# Altium project Vortex_PID_Main.PrjPcb
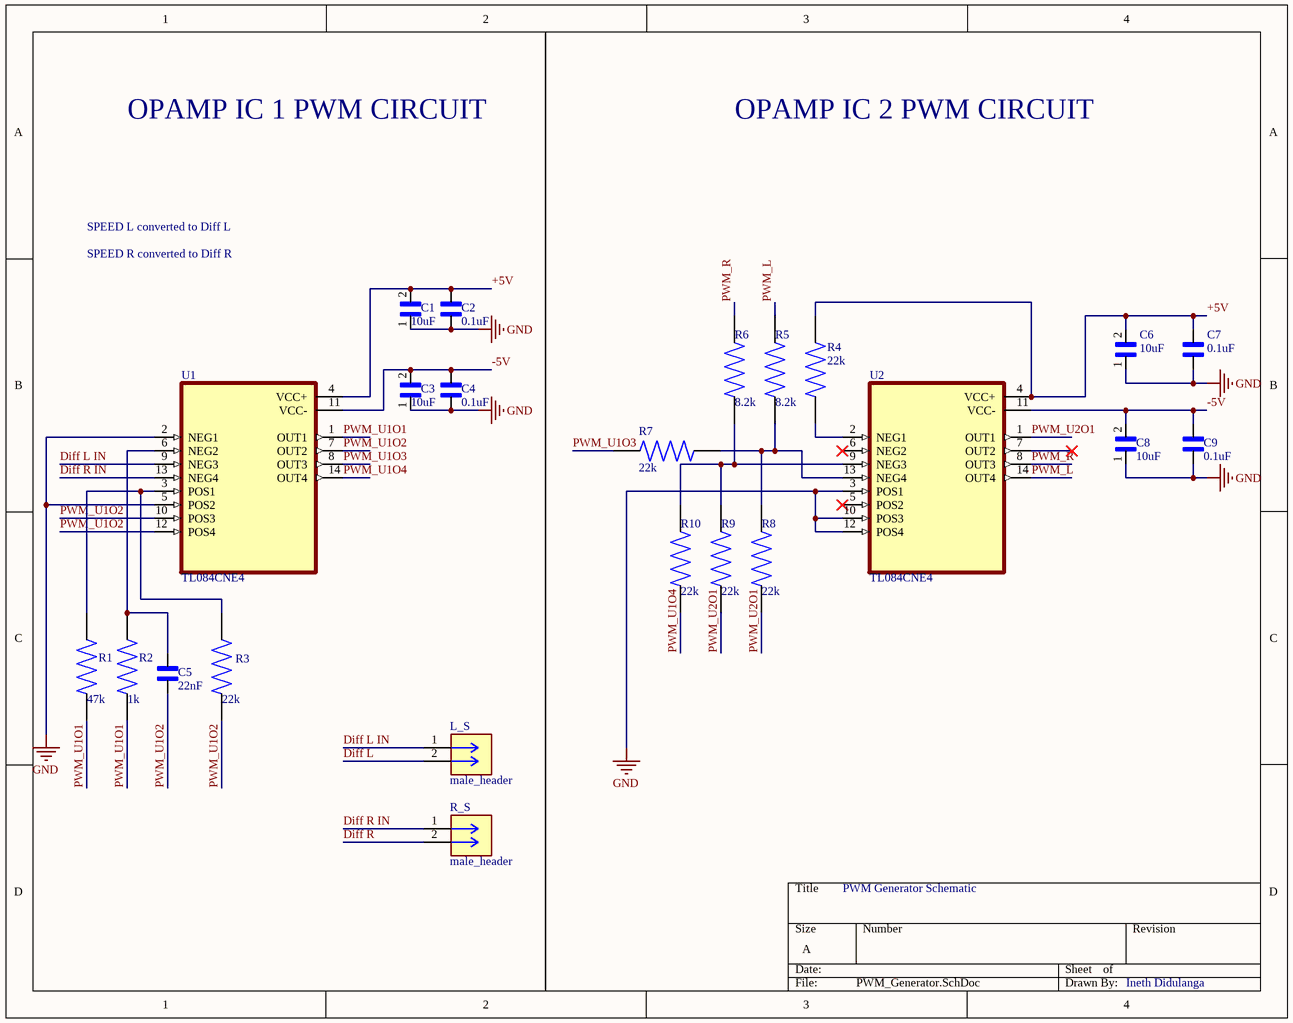
[diagram p0: PWM_Generator.SchDoc]
7 sheets, 148 parts. Net scope: global (net labels, ports and power ports of the same name join across sheets).
Board file: Vortex_PCB_final.PcbDoc
Sheets:
  PWM_Generator.SchDoc
  Differential_Drive_Mixer.SchDoc
  Sensor_Interface_SharpIR.SchDoc
  Mosfet_HBridge_Driver.SchDoc
  Power_Management.SchDoc
  PID_Controller.SchDoc
  Front Obstacle Brake.SchDoc

## Sheet PWM_Generator.SchDoc
size A; SheetNumber: 1; SheetTotal: 7

### Parts
C1  10uF  [CAPC2012X145N]
C2  0.1uF  [CAPC2012X140N]
C3  10uF  [CAPC2012X145N]
C4  0.1uF  [CAPC2012X140N]
C5  22nF  [CAPC2012X135N]
C6  10uF  [CAPC2012X145N]
C7  0.1uF  [CAPC2012X140N]
C8  10uF  [CAPC2012X145N]
C9  0.1uF  [CAPC2012X140N]
L_S  male_header  [CONN02_901200922_MOL]
R1  47k  [RESC2012X65N]
R2  1k  [RESC2012X55N]
R3  22k  [RESC2012X65N]
R4  22k  [RESC2012X65N]
R5  8.2k  [RESC2012X65N]
R6  8.2k  [RESC2012X65N]
R7  22k  [RESC2012X65N]
R8  22k  [RESC2012X65N]
R9  22k  [RESC2012X65N]
R10  22k  [RESC2012X65N]
R_S  male_header  [CONN02_901200922_MOL]
U1  TL084CNE4  [SOIC127P780X200-14N]
U2  TL084CNE4  [SOIC127P780X200-14N]

### Nets
+5V: C1.2 C2.1 C6.2 C7.1 R4.2 U1.4(VCC+) U2.4(VCC+)
-5V: C3.2 C4.1 C8.2 C9.1 U1.11(VCC-) U2.11(VCC-)
GND: C1.1 C2.2 C3.1 C4.2 C6.1 C7.2 C8.1 C9.2 U1.2(NEG1) U1.5(POS2) U2.3(POS1) U2.10(POS3) U2.12(POS4)
Diff L: L_S.2
Diff L IN: L_S.1 U1.9(NEG3)
Diff R: R_S.2
Diff R IN: R_S.1 U1.13(NEG4)
PWM_L: R5.2 U2.14(OUT4)
PWM_R: R6.2 U2.8(OUT3)
PWM_U1O1: R1.1 R2.1 U1.1(OUT1)
PWM_U1O2: C5.1 R3.1 U1.7(OUT2) U1.10(POS3) U1.12(POS4)
PWM_U1O3: R7.1 U1.8(OUT3)
PWM_U1O4: R10.1 U1.14(OUT4)
PWM_U2O1: R8.1 R9.1 U2.1(OUT1)
NetC5_2: C5.2 R2.2 U1.6(NEG2)
NetR1_2: R1.2 R3.2 U1.3(POS1)
NetR4_1: R4.1 U2.2(NEG1)
NetR5_1: R5.1 R7.2 R8.2 U2.13(NEG4)
NetR6_1: R6.1 R9.2 R10.2 U2.9(NEG3)

Not connected (* = marked no-connect by the designer): U2 5(POS2)* 6(NEG2)* 7(OUT2)*

### Notes on the sheet
- OPAMP IC 1 PWM CIRCUIT
- OPAMP IC 2 PWM CIRCUIT
- SPEED L converted to Diff L
- SPEED R converted to Diff R
- PWM Generator Schematic
- Ineth Didulanga

### Library data of the parts
C1 C3 C6 C8 = C2012X6S1C106K125AC: C Series 0805 10 uF 16 V Â±10 % Tolerance X6S SMT Multilayer Ceramic Capacitor; MF: TDK; MP: C2012X6S1C106K125AC; SnapEDA_Link: https://www.snapeda.com/parts/C2012X6S1C106K125AC/TDK-Lambda+Americas+Inc/view-part/?ref=snap; Check_prices: https://www.snapeda.com/parts/C2012X6S1C106K125AC/TDK-Lambda+Americas+Inc/view-part/?ref=eda; Value: *; Purchase-URL: https://pricing.snapeda.com/search/part/C2012X6S1C106K125AC/?ref=eda; Package: 2012 TDK
C2 C4 C7 C9 = FS055C104K4Z2A: 0.1 ÂµF Â±10% 50V Ceramic Capacitor X7R 0805 (2012 Metric); MF: AVX; SnapEDA_Link: https://www.snapeda.com/parts/FS055C104K4Z2A/AVX/view-part/?ref=snap; Package: 0805-2 AVX; Value: *; MP: FS055C104K4Z2A; Check_prices: https://www.snapeda.com/parts/FS055C104K4Z2A/AVX/view-part/?ref=eda
C5 = GRM21B5C1H223JA01L: 0805 22 nF 50 V Â±5% Tolerance C0G SMT Multilayer Ceramic Capacitor; MF: Murata; SnapEDA_Link: https://www.snapeda.com/parts/GRM21B5C1H223JA01L/Murata/view-part/?ref=snap; Package: 805-2 Murata; Value: *; MP: GRM21B5C1H223JA01L; Check_prices: https://www.snapeda.com/parts/GRM21B5C1H223JA01L/Murata/view-part/?ref=eda
L_S R_S = 901200922: Package: None; Price: None; Value: *; MP: 901200922; Availability: Unavailable
R1 = CRGCQ0805F47K: Fixed Resistor CRGCQ 0805 47K 1%; MF: TE Connectivity; SnapEDA_Link: https://www.snapeda.com/parts/CRGCQ0805F47K/TE+Connectivity/view-part/?ref=snap; Package: 2012 TE Connectivity; Value: *; MP: CRGCQ0805F47K; Check_prices: https://www.snapeda.com/parts/CRGCQ0805F47K/TE+Connectivity/view-part/?ref=eda
R2 = MCU08050C1002FPW00: Res Thin Film 0805 10K Ohm 1% 0.125W(1/8W) Â±50ppm/Â°C Sulfur Resistant Pad SMD Automotive Medical T/R; MF: Vishay; SnapEDA_Link: https://www.snapeda.com/parts/MCU08050C1002FPW00/Vishay/view-part/?ref=snap; Package: 2012 Vishay; Value: *; MP: MCU08050C1002FPW00; Check_prices: https://www.snapeda.com/parts/MCU08050C1002FPW00/Vishay/view-part/?ref=eda
R3-R10 = CRGCQ0805F22K: Fixed Resistor CRGCQ 0805 22K 1%; MF: TE Connectivity; SnapEDA_Link: https://www.snapeda.com/parts/CRGCQ0805F22K/TE+Connectivity/view-part/?ref=snap; Package: 2012 TE Connectivity; Value: *; MP: CRGCQ0805F22K; Check_prices: https://www.snapeda.com/parts/CRGCQ0805F22K/TE+Connectivity/view-part/?ref=eda
U1 U2 = TL084CNE4: Quad High Slew Rate JFET-Input Operational Amplifier 14-PDIP 0 to 70; MF: Texas Instruments; SnapEDA_Link: https://www.snapeda.com/parts/TL084CNE4/Texas+Instruments/view-part/?ref=snap; Package: PDIP-14 Texas Instruments; Value: *; MP: TL084CNE4; Check_prices: https://www.snapeda.com/parts/TL084CNE4/Texas+Instruments/view-part/?ref=eda

## Sheet Differential_Drive_Mixer.SchDoc
size A; SheetNumber: 2; SheetTotal: 7
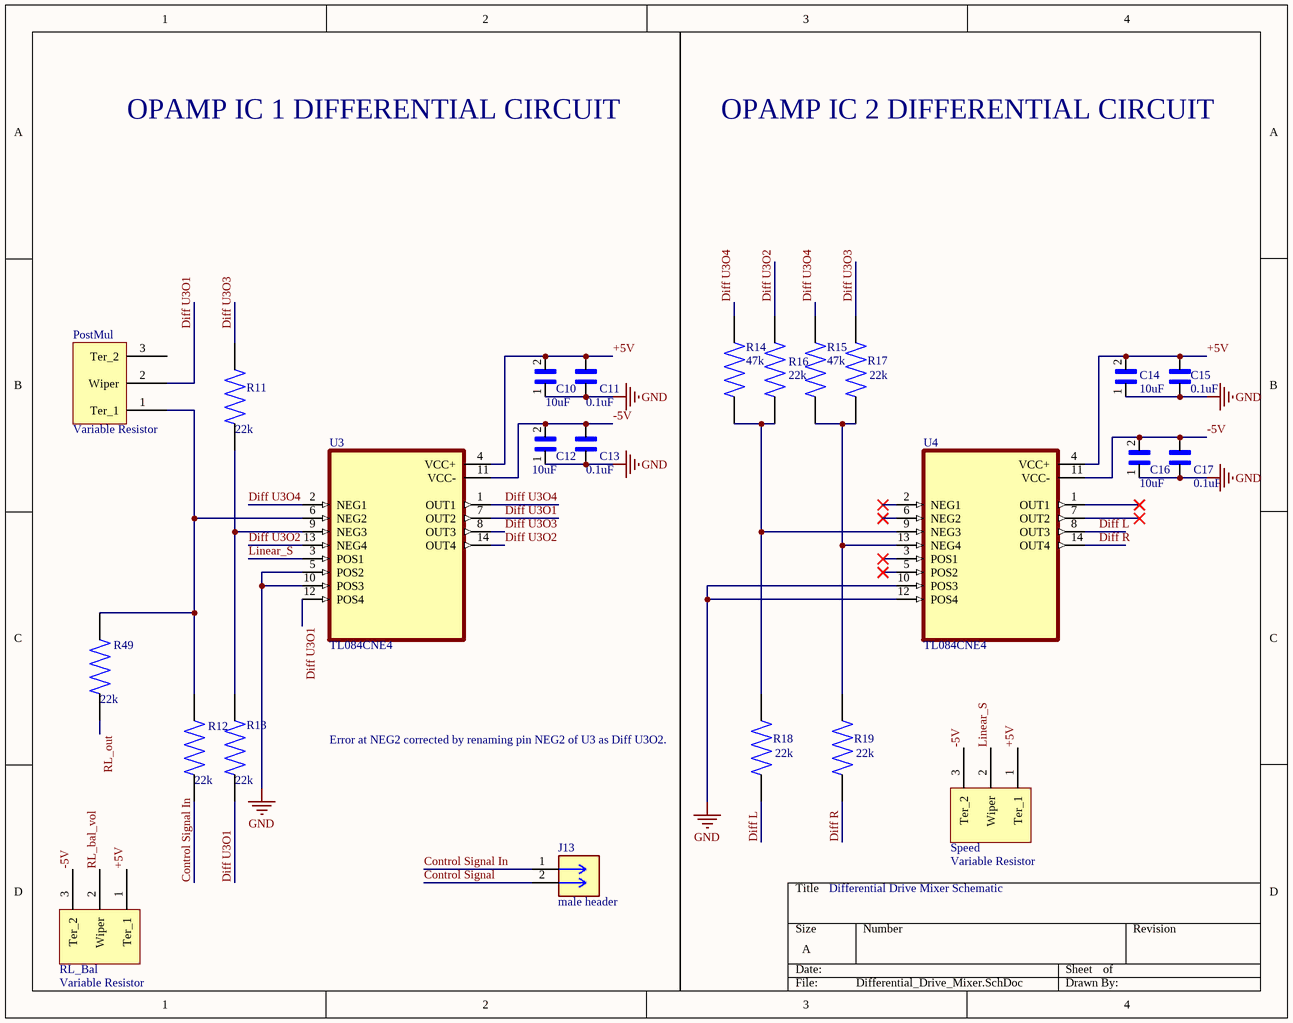
[diagram p1: Differential_Drive_Mixer.SchDoc]

### Parts
C10  10uF  [CAPC2012X145N]
C11  0.1uF  [CAPC2012X140N]
C12  10uF  [CAPC2012X145N]
C13  0.1uF  [CAPC2012X140N]
C14  10uF  [CAPC2012X145N]
C15  0.1uF  [CAPC2012X140N]
C16  10uF  [CAPC2012X145N]
C17  0.1uF  [CAPC2012X140N]
J13  male header  [CONN02_901200922_MOL]
PostMul  Variable Resistor  [PCBComponent_1]
R11  22k  [RESC2012X65N]
R12  22k  [RESC2012X65N]
R13  22k  [RESC2012X65N]
R14  47k  [RESC2012X65N]
R15  47k  [RESC2012X65N]
R16  22k  [RESC2012X65N]
R17  22k  [RESC2012X65N]
R18  22k  [RESC2012X65N]
R19  22k  [RESC2012X65N]
R49  22k  [RESC2012X65N]
RL_Bal  Variable Resistor  [PCBComponent_1]
Speed  Variable Resistor  [PCBComponent_1]
U3  TL084CNE4  [SOIC127P780X200-14N]
U4  TL084CNE4  [SOIC127P780X200-14N]

### Nets
+5V: C10.2 C11.1 C14.2 C15.1 RL_Bal.1(Ter_1) Speed.1(Ter_1) U3.4(VCC+) U4.4(VCC+)
-5V: C12.2 C13.1 C16.2 C17.1 RL_Bal.3(Ter_2) Speed.3(Ter_2) U3.11(VCC-) U4.11(VCC-)
GND: C10.1 C11.2 C12.1 C13.2 C14.1 C15.2 C16.1 C17.2 U3.5(POS2) U3.10(POS3) U4.10(POS3) U4.12(POS4)
Control Signal: J13.2
Control Signal In: J13.1 R12.1
Diff L: R18.2 U4.8(OUT3)
Diff R: R19.2 U4.14(OUT4)
Diff U3O1: PostMul.2(Wiper) R13.1 U3.7(OUT2) U3.12(POS4)
Diff U3O2: R16.1 U3.13(NEG4) U3.14(OUT4)
Diff U3O3: R11.1 R17.1 U3.8(OUT3)
Diff U3O4: R14.2 R15.2 U3.1(OUT1) U3.2(NEG1)
Linear_S: Speed.2(Wiper) U3.3(POS1)
RL_bal_vol: RL_Bal.2(Wiper)
RL_out: R49.1
NetPostMul_1: PostMul.1(Ter_1) R12.2 R49.2 U3.6(NEG2)
NetR11_2: R11.2 R13.2 U3.9(NEG3)
NetR14_1: R14.1 R16.2 R18.1 U4.9(NEG3)
NetR15_1: R15.1 R17.2 R19.1 U4.13(NEG4)

Not connected (* = marked no-connect by the designer): PostMul 3(Ter_2); U4 1(OUT1)* 2(NEG1)* 3(POS1)* 5(POS2)* 6(NEG2)* 7(OUT2)*

### Notes on the sheet
- OPAMP IC 1 DIFFERENTIAL CIRCUIT
- OPAMP IC 2 DIFFERENTIAL CIRCUIT
- (near R18) Error at NEG2 corrected by renaming pin NEG2 of U3 as Diff U3O2.
- Differential Drive Mixer Schematic

### Library data of the parts
C10 C12 C14 C16 = C2012X6S1C106K125AC: as C1 on sheet PWM_Generator; MP: C2012X6S1C106K125AC; SnapEDA_Link: https://www.snapeda.com/parts/C2012X6S1C106K125AC/TDK-Lambda+Americas+Inc/view-part/?ref=snap; Check_prices: https://www.snapeda.com/parts/C2012X6S1C106K125AC/TDK-Lambda+Americas+Inc/view-part/?ref=eda; Value: *; Purchase-URL: https://pricing.snapeda.com/search/part/C2012X6S1C106K125AC/?ref=eda; Package: 2012 TDK
C11 C13 C15 C17 = FS055C104K4Z2A: as C2 on sheet PWM_Generator; SnapEDA_Link: https://www.snapeda.com/parts/FS055C104K4Z2A/AVX/view-part/?ref=snap; Package: 0805-2 AVX; Value: *; MP: FS055C104K4Z2A; Check_prices: https://www.snapeda.com/parts/FS055C104K4Z2A/AVX/view-part/?ref=eda
J13 = 901200922: Package: None; Price: None; Value: *; MP: 901200922; Availability: Unavailable
R11-R13 R16-R19 R49 = CRGCQ0805F22K: as R3 on sheet PWM_Generator; SnapEDA_Link: https://www.snapeda.com/parts/CRGCQ0805F22K/TE+Connectivity/view-part/?ref=snap; Package: 2012 TE Connectivity; Value: *; MP: CRGCQ0805F22K; Check_prices: https://www.snapeda.com/parts/CRGCQ0805F22K/TE+Connectivity/view-part/?ref=eda
R14 R15 = CRGCQ0805F47K: as R1 on sheet PWM_Generator; SnapEDA_Link: https://www.snapeda.com/parts/CRGCQ0805F47K/TE+Connectivity/view-part/?ref=snap; Package: 2012 TE Connectivity; Value: *; MP: CRGCQ0805F47K; Check_prices: https://www.snapeda.com/parts/CRGCQ0805F47K/TE+Connectivity/view-part/?ref=eda
U3 U4 = TL084CNE4: as U1 on sheet PWM_Generator; SnapEDA_Link: https://www.snapeda.com/parts/TL084CNE4/Texas+Instruments/view-part/?ref=snap; Package: PDIP-14 Texas Instruments; Value: *; MP: TL084CNE4; Check_prices: https://www.snapeda.com/parts/TL084CNE4/Texas+Instruments/view-part/?ref=eda

## Sheet Sensor_Interface_SharpIR.SchDoc
size A; SheetNumber: 3; SheetTotal: 7
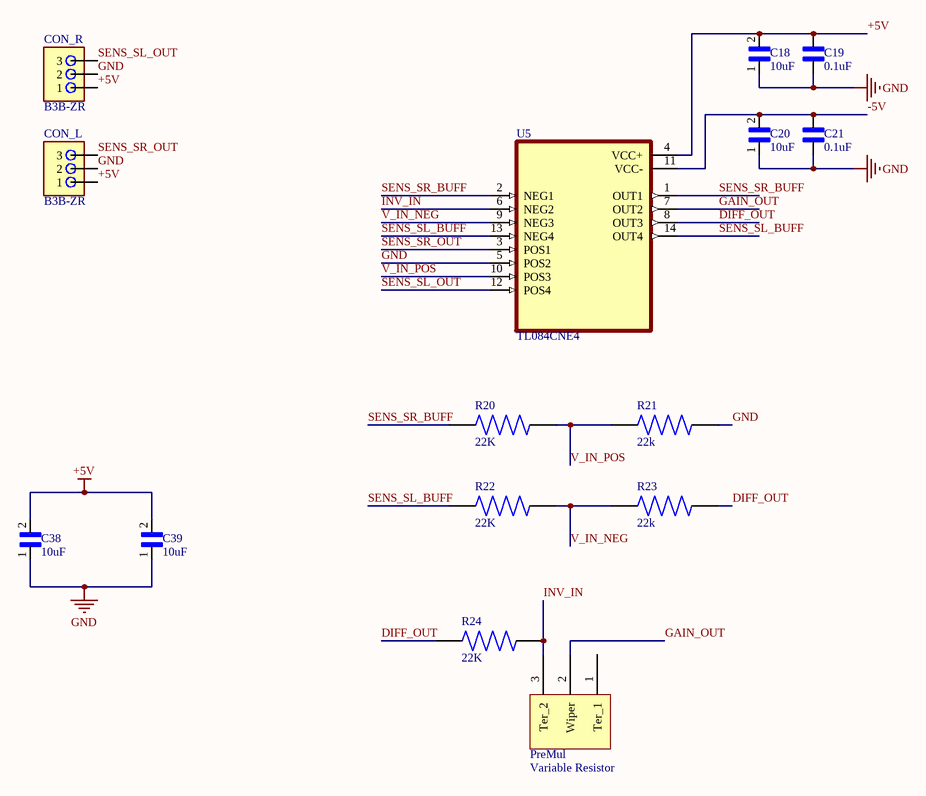
[diagram p2: Sensor_Interface_SharpIR.SchDoc]

### Parts
C18  10uF  [CAPC2012X145N]
C19  0.1uF  [CAPC2012X140N]
C20  10uF  [CAPC2012X145N]
C21  0.1uF  [CAPC2012X140N]
C38  10uF  [CAPC2012X145N]
C39  10uF  [CAPC2012X145N]
CON_L  B3B-ZR  [B3B-ZR]
CON_R  B3B-ZR  [B3B-ZR]
PreMul  Variable Resistor  [PCBComponent_1]
R20  22K  [RESC2012X65N]
R21  22k  [RESC2012X65N]
R22  22K  [RESC2012X65N]
R23  22k  [RESC2012X65N]
R24  22K  [RESC2012X65N]
U5  TL084CNE4  [SOIC127P780X200-14N]

### Nets
+5V: C18.2 C19.1 C38.2 C39.2 CON_L.1 CON_R.1 U5.4(VCC+)
-5V: C20.2 C21.1 U5.11(VCC-)
GND: C18.1 C19.2 C20.1 C21.2 C38.1 C39.1 CON_L.2 CON_R.2 R21.2 U5.5(POS2)
DIFF_OUT: R23.2 R24.1 U5.8(OUT3)
GAIN_OUT: PreMul.2(Wiper) U5.7(OUT2)
INV_IN: PreMul.3(Ter_2) R24.2 U5.6(NEG2)
SENS_SL_BUFF: R22.1 U5.13(NEG4) U5.14(OUT4)
SENS_SL_OUT: CON_R.3 U5.12(POS4)
SENS_SR_BUFF: R20.1 U5.1(OUT1) U5.2(NEG1)
SENS_SR_OUT: CON_L.3 U5.3(POS1)
V_IN_NEG: R22.2 R23.1 U5.9(NEG3)
V_IN_POS: R20.2 R21.1 U5.10(POS3)

Not connected (* = marked no-connect by the designer): PreMul 1(Ter_1)

### Library data of the parts
C18 C20 C38 C39 = C2012X6S1C106K125AC: as C1 on sheet PWM_Generator; MP: C2012X6S1C106K125AC; SnapEDA_Link: https://www.snapeda.com/parts/C2012X6S1C106K125AC/TDK-Lambda+Americas+Inc/view-part/?ref=snap; Check_prices: https://www.snapeda.com/parts/C2012X6S1C106K125AC/TDK-Lambda+Americas+Inc/view-part/?ref=eda; Value: *; Purchase-URL: https://pricing.snapeda.com/search/part/C2012X6S1C106K125AC/?ref=eda; Package: 2012 TDK
C19 C21 = FS055C104K4Z2A: as C2 on sheet PWM_Generator; SnapEDA_Link: https://www.snapeda.com/parts/FS055C104K4Z2A/AVX/view-part/?ref=snap; Package: 0805-2 AVX; Value: *; MP: FS055C104K4Z2A; Check_prices: https://www.snapeda.com/parts/FS055C104K4Z2A/AVX/view-part/?ref=eda
CON_L CON_R = B3B-ZR: Connector Header Surface Mount 3 position 0.059 (1.50mm); MF: JST Sales; SnapEDA_Link: https://www.snapeda.com/parts/B3B-ZR/JST+Sales+America+Inc./view-part/?ref=snap; Package: None; Value: *; MP: B3B-ZR; Check_prices: https://www.snapeda.com/parts/B3B-ZR/JST+Sales+America+Inc./view-part/?ref=eda
R20-R24 = CRGCQ0805F22K: as R3 on sheet PWM_Generator; SnapEDA_Link: https://www.snapeda.com/parts/CRGCQ0805F22K/TE+Connectivity/view-part/?ref=snap; Package: 2012 TE Connectivity; Value: *; MP: CRGCQ0805F22K; Check_prices: https://www.snapeda.com/parts/CRGCQ0805F22K/TE+Connectivity/view-part/?ref=eda
U5 = TL084CNE4: as U1 on sheet PWM_Generator; SnapEDA_Link: https://www.snapeda.com/parts/TL084CNE4/Texas+Instruments/view-part/?ref=snap; Package: PDIP-14 Texas Instruments; Value: *; MP: TL084CNE4; Check_prices: https://www.snapeda.com/parts/TL084CNE4/Texas+Instruments/view-part/?ref=eda

## Sheet Mosfet_HBridge_Driver.SchDoc
size A; SheetNumber: 4; SheetTotal: 7
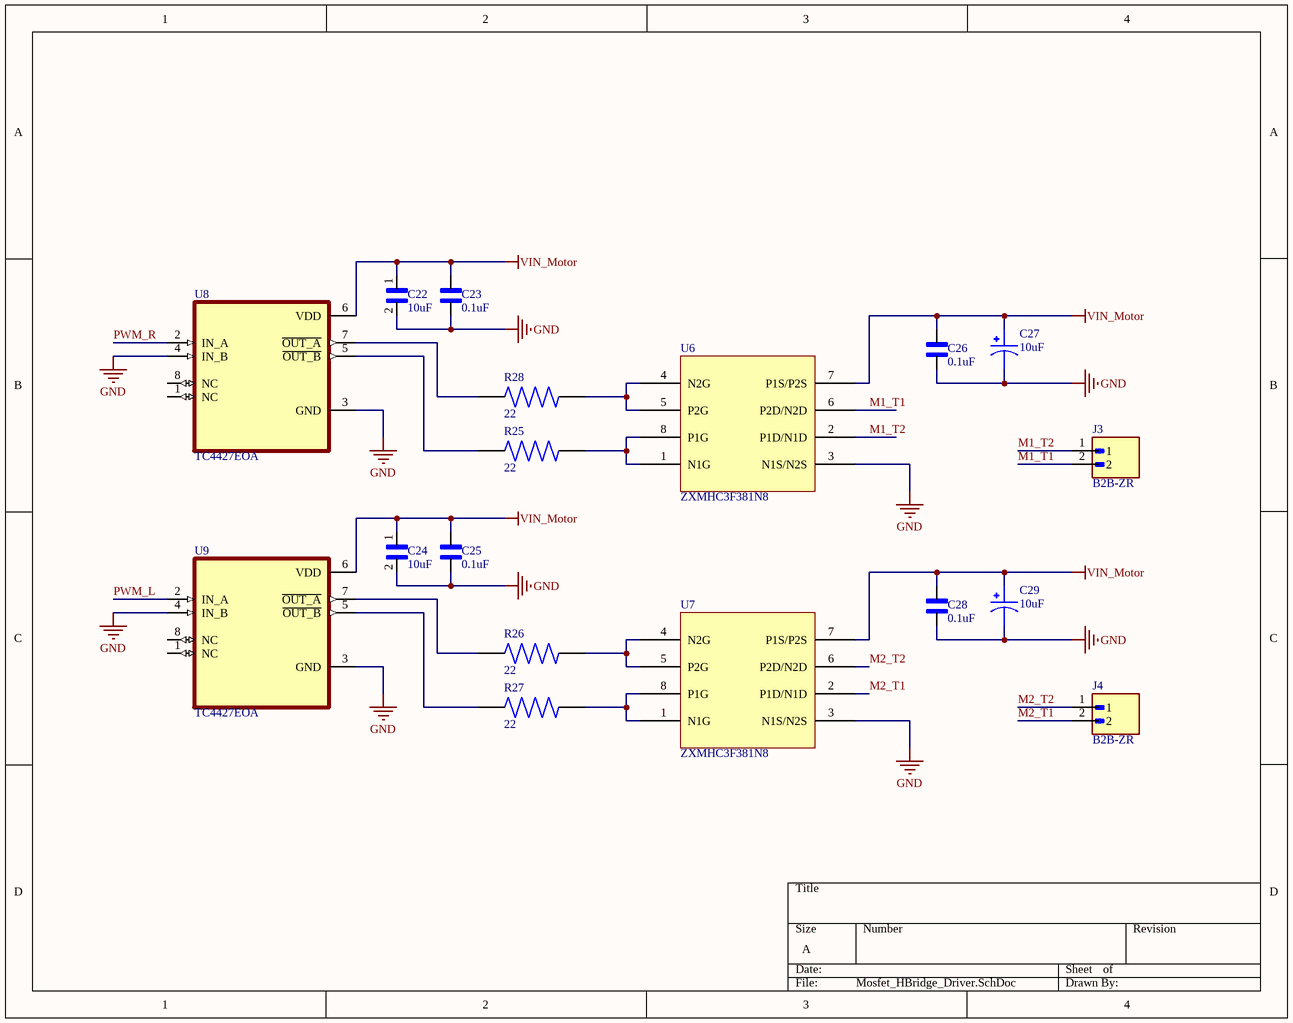
[diagram p3: Mosfet_HBridge_Driver.SchDoc]

### Parts
C22  10uF  [CAPC2012X145N]
C23  0.1uF  [CAPC2012X140N]
C24  10uF  [CAPC2012X145N]
C25  0.1uF  [CAPC2012X140N]
C26  0.1uF  [CAPC2012X140N]
C27  10uF  [CAPAE660X610N]
C28  0.1uF  [CAPC2012X140N]
C29  10uF  [CAPAE660X610N]
J3  B2B-ZR  [JST_B2B-ZR(LF)(SN)]
J4  B2B-ZR  [JST_B2B-ZR(LF)(SN)]
R25  22  [RES_ERJU06F22R0V]
R26  22  [RES_ERJU06F22R0V]
R27  22  [RES_ERJU06F22R0V]
R28  22  [RES_ERJU06F22R0V]
U6  ZXMHC3F381N8  [SOIC127P600X175-8N]
U7  ZXMHC3F381N8  [SOIC127P600X175-8N]
U8  TC4427EOA  [SOIC127P599X175-8N]
U9  TC4427EOA  [SOIC127P599X175-8N]

### Nets
GND: C22.2 C23.1 C24.2 C25.1 C26.1 C27.N(NEG) C28.1 C29.N(NEG) U6.3(N1S/N2S) U7.3(N1S/N2S) U8.3(GND) U8.4(IN_B) U9.3(GND) U9.4(IN_B)
VIN_Motor: C22.1 C23.2 C24.1 C25.2 C26.2 C27.P(POS) C28.2 C29.P(POS) U6.7(P1S/P2S) U7.7(P1S/P2S) U8.6(VDD) U9.6(VDD)
M1_T1: J3.2 U6.6(P2D/N2D)
M1_T2: J3.1 U6.2(P1D/N1D)
M2_T1: J4.2 U7.2(P1D/N1D)
M2_T2: J4.1 U7.6(P2D/N2D)
PWM_L: U9.2(IN_A)
PWM_R: U8.2(IN_A)
NetR25_1: R25.1 U8.5(~{OUT_B})
NetR25_2: R25.2 U6.1(N1G) U6.8(P1G)
NetR26_1: R26.1 U9.7(~{OUT_A})
NetR26_2: R26.2 U7.4(N2G) U7.5(P2G)
NetR27_1: R27.1 U9.5(~{OUT_B})
NetR27_2: R27.2 U7.1(N1G) U7.8(P1G)
NetR28_1: R28.1 U8.7(~{OUT_A})
NetR28_2: R28.2 U6.4(N2G) U6.5(P2G)

Not connected (* = marked no-connect by the designer): U8 1(NC) 8(NC); U9 1(NC) 8(NC)

### Library data of the parts
C22 C24 = C2012X6S1C106K125AC: as C1 on sheet PWM_Generator; MP: C2012X6S1C106K125AC; SnapEDA_Link: https://www.snapeda.com/parts/C2012X6S1C106K125AC/TDK-Lambda+Americas+Inc/view-part/?ref=snap; Check_prices: https://www.snapeda.com/parts/C2012X6S1C106K125AC/TDK-Lambda+Americas+Inc/view-part/?ref=eda; Value: *; Purchase-URL: https://pricing.snapeda.com/search/part/C2012X6S1C106K125AC/?ref=eda; Package: 2012 TDK
C23 C25 C26 C28 = FS055C104K4Z2A: as C2 on sheet PWM_Generator; SnapEDA_Link: https://www.snapeda.com/parts/FS055C104K4Z2A/AVX/view-part/?ref=snap; Package: 0805-2 AVX; Value: *; MP: FS055C104K4Z2A; Check_prices: https://www.snapeda.com/parts/FS055C104K4Z2A/AVX/view-part/?ref=eda
C27 C29 = UUD1H100MCL1GS: Aluminum Electrolytic Capacitors - SMD, Low Impediance, 50volts 10uF | Nichicon UUD1H100MCL1GS; SnapEDA_Link: https://www.snapeda.com/parts/UUD1H100MCL1GS/Nichicon/view-part/?ref=snap; Package: RADIAL-2 Nichicon; Value: *; MF: Nichicon; MP: UUD1H100MCL1GS; Check_prices: https://www.snapeda.com/parts/UUD1H100MCL1GS/Nichicon/view-part/?ref=eda
J3 J4 = B2B-ZR(LF)(SN): Connector Header Through Hole 2 position 0.059 (1.50mm); MF: JST Sales; SnapEDA_Link: https://www.snapeda.com/parts/B2B-ZR(LF)(SN)/JST+Sales+America+Inc./view-part/?ref=snap; Package: None; Value: *; MP: B2B-ZR(LF)(SN); Check_prices: https://www.snapeda.com/parts/B2B-ZR(LF)(SN)/JST+Sales+America+Inc./view-part/?ref=eda
R25-R28 = ERJU06F22R0V: MP: ERJU06F22R0V; Availability: Unavailable; Price: None; Package: None; Value: *
U6 U7 = ZXMHC3F381N8: N-Channel+P-Channel Array 30V 4.1A 0.95W Surface Mount SO-8
U8 U9 = TC4427EOA: Low-Side Gate Driver IC Non-Inverting 8-SOIC; MF: Microchip; Check_prices: https://www.snapeda.com/parts/TC4427EOA/Microchip/view-part/?ref=eda; Value: *; Availability: In Stock; MP: TC4427EOA; Price: None; Package: SOIC-8 Microchip; SnapEDA_Link: https://www.snapeda.com/parts/TC4427EOA/Microchip/view-part/?ref=snap; Purchase-URL: https://pricing.snapeda.com/search/part/TC4427EOA/?ref=eda

## Sheet Power_Management.SchDoc
size A; SheetNumber: 5; SheetTotal: 7
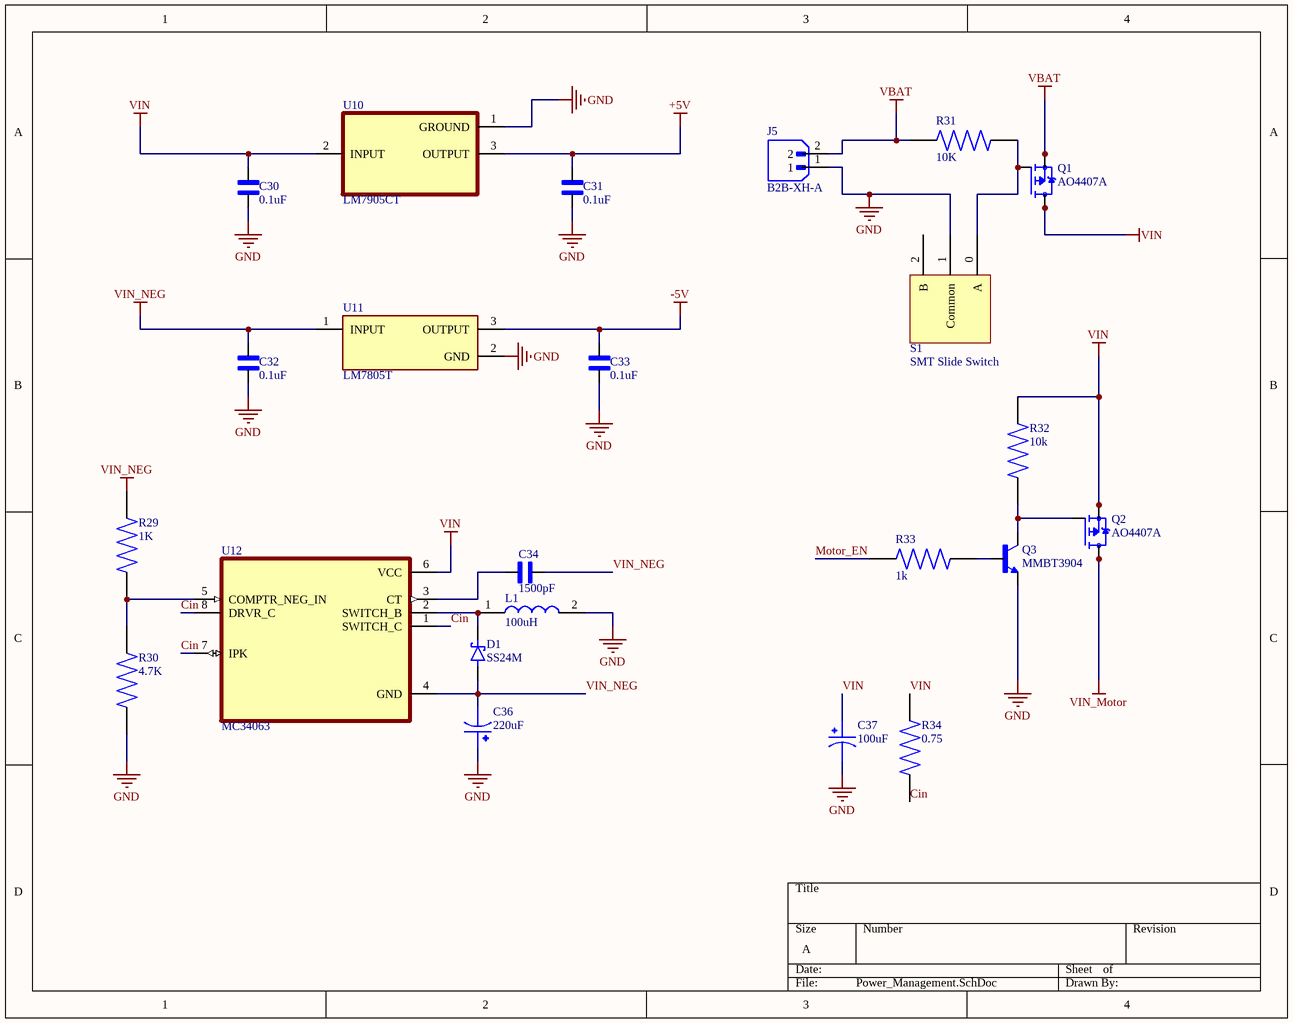
[diagram p4: Power_Management.SchDoc]

### Parts
C30  0.1uF  [CAPC2012X140N]
C31  0.1uF  [CAPC2012X140N]
C32  0.1uF  [CAPC2012X140N]
C33  0.1uF  [CAPC2012X140N]
C34  1500pF  [CAPC2012X145N]
C36  220uF  [CAPAE1030X1080N_UWT1H221MNL1GS]
C37  100uF  [CAPAE1030X1080N_UWT1H221MNL1GS]
D1  SS24M  [SODFL2512X73N]
J5  B2B-XH-A  [JST_B2B-XH-A]
L1  100uH  [INDPM125125X800N]
Q1  AO4407A  [SOIC127P600X175-8N]
Q2  AO4407A  [SOIC127P600X175-8N]
Q3  MMBT3904  [TRANS_MMBT3904]
R29  1K  [RES_ERJU06F1001V]
R30  4.7K  [RES_ERJU06F1001V]
R31  10K  [RESC2012X55N]
R32  10k  [RESC2012X55N]
R33  1k  [RES_ERJU06F1001V]
R34  0.75  [RES_ERJ6BQJR75V]
S1  SMT Slide Switch  [PCBComponent_1]
U10  LM7905CT  [TO254P1054X470X1955-3]
U11  LM7805T  [TO254P1011X457X1950-3]
U12  MC34063  [SOIC127P599X175-8N]

### Nets
+5V: C31.2 U10.3(OUTPUT)
-5V: C33.2 U11.3(OUTPUT)
GND: C30.1 C31.1 C32.1 C33.1 C36.1 C37.2 J5.1 L1.2 Q3.2(E) R30.1 S1.1(Common) U10.1(GROUND) U11.2(GND)
VBAT: J5.2 Q1.1(S) Q1.2(S) Q1.3(S) R31.1
VIN: C30.2 C37.1 Q1.5(D) Q1.6(D) Q1.7(D) Q1.8(D) Q2.1(S) Q2.2(S) Q2.3(S) R32.2 R34.2 U10.2(INPUT) U12.6(VCC)
VIN_Motor: Q2.5(D) Q2.6(D) Q2.7(D) Q2.8(D)
VIN_NEG: C32.2 C34.2 C36.2 D1.A R29.2 U11.1(INPUT) U12.4(GND)
Cin: R34.1 U12.1(SWITCH_C) U12.7(IPK) U12.8(DRVR_C)
Motor_EN: R33.1
NetC34_1: C34.1 U12.3(CT)
NetD1_C: D1.C(K) L1.1 U12.2(SWITCH_B)
NetQ1_4: Q1.4(G) R31.2 S1.0(A)
NetQ2_4: Q2.4(G) Q3.3(C) R32.1
NetQ3_1: Q3.1(B) R33.2
NetR29_1: R29.1 R30.2 U12.5(COMPTR_NEG_IN)

Not connected (* = marked no-connect by the designer): S1 2(B)

### Library data of the parts
C30-C33 = FS055C104K4Z2A: as C2 on sheet PWM_Generator; SnapEDA_Link: https://www.snapeda.com/parts/FS055C104K4Z2A/AVX/view-part/?ref=snap; Package: 0805-2 AVX; Value: *; MP: FS055C104K4Z2A; Check_prices: https://www.snapeda.com/parts/FS055C104K4Z2A/AVX/view-part/?ref=eda
C34 = VJ0805A152JXAAC: 1500 pF Â±5% 50V Ceramic Capacitor C0G, NP0 0805 (2012 Metric); MF: Vishay Vitramon; SnapEDA_Link: https://www.snapeda.com/parts/VJ0805A152JXAAC/Vishay/view-part/?ref=snap; Package: 2012 Vishay Vitramon; Value: *; MP: VJ0805A152JXAAC; Check_prices: https://www.snapeda.com/parts/VJ0805A152JXAAC/Vishay/view-part/?ref=eda
C36 C37 = UWT1H221MNL1GS: 220ÂµF 50V Aluminum Electrolytic Capacitors Radial, Can - SMD 1000 Hrs @ 105Â°C; MF: Nichicon; Package: Radial Nichicon; Price: None; Availability: Unavailable; MP: UWT1H221MNL1GS; SnapEDA_Link: https://www.snapeda.com/parts/UWT1H221MNL1GS/Nichicon/view-part/566503/?ref=snap; Value: *
J5 = B2B-XH-A: MF: {'manufacturer': u'JST Sales America Inc.'}; Package: None; Price: None; Value: *; MP: B2B-XH-A; Availability: Unavailable
L1 = SRR1280-101M: 100ÂµH Shielded Wirewound Inductor 2.1A 150mOhm Max Nonstandard; MF: Bourns; Purchase-URL: https://pricing.snapeda.com/search/part/SRR1280-101M/?ref=eda; Price: None; SnapEDA_Link: https://www.snapeda.com/parts/SRR1280-101M/Bourns%20-%20J.W.%20Miller/view-part/289867/?ref=snap; MP: SRR1280-101M; Availability: Good; Value: *; Check_prices: https://www.snapeda.com/parts/SRR1280-101M/Bourns%20-%20J.W.%20Miller/view-part/289867/?ref=eda; Package: Nonstandard Bourns
Q1 Q2 = AO4407A: P-Channel 30 V 12A (Ta) 3.1W (Ta) Surface Mount 8-SOIC; MF: Alpha &; SnapEDA_Link: https://www.snapeda.com/parts/AO4407A/Alpha/view-part/?ref=snap; Package: SOIC-8 Alpha &amp; Omega Semiconductor; Value: *; MP: AO4407A; Check_prices: https://www.snapeda.com/parts/AO4407A/Alpha/view-part/?ref=eda
Q3 = MMBT3904: BJT, SOT-23, 40V, 200mA, NPN, 0.35W, 150Â°C; MF: Diotec Semiconductor; SnapEDA_Link: https://www.snapeda.com/parts/MMBT3904/Diotec/view-part/?ref=snap; Package: SOT-23 Diotec; Value: *; MP: MMBT3904; Check_prices: https://www.snapeda.com/parts/MMBT3904/Diotec/view-part/?ref=eda
R29 R30 R33 = ERJU06F1001V: Res Thick Film 0805 1K Ohm 1% 0.125W(1/8W) Â±100ppm/C Sulfur Resistant Pad SMD Automotive T/R; MF: Panasonic; Availability: No availability data; Value: *; Check_prices: https://www.snapeda.com/parts/ERJU06F1001V/Panasonic/view-part/5742057/?ref=eda; Package: 2012-2 Panasonic; SnapEDA_Link: https://www.snapeda.com/parts/ERJU06F1001V/Panasonic/view-part/5742057/?ref=snap; Price: None; MP: ERJU06F1001V
R31 R32 = MCU08050C1002FPW00: as R2 on sheet PWM_Generator; SnapEDA_Link: https://www.snapeda.com/parts/MCU08050C1002FPW00/Vishay/view-part/?ref=snap; Package: 2012 Vishay; Value: *; MP: MCU08050C1002FPW00; Check_prices: https://www.snapeda.com/parts/MCU08050C1002FPW00/Vishay/view-part/?ref=eda
R34 = ERJ6BQJR75V: Value: *; MP: ERJ6BQJR75V; Availability: Unavailable; Price: None; Package: None
U10 = LM7905CT: 1.5-A, negative linear voltage regulator 3-TO-220 0 to 125; MF: Texas Instruments; SnapEDA_Link: https://www.snapeda.com/parts/LM7905CT/Texas+Instruments/view-part/?ref=snap; Package: TO-220-3 Texas Instruments; Value: *; MP: LM7905CT; Check_prices: https://www.snapeda.com/parts/LM7905CT/Texas+Instruments/view-part/?ref=eda
U11 = LM7805T: 3-Terminal 1.5A Positive Fixed Voltage Regulator; MF: TAEJIN; SnapEDA_Link: https://www.snapeda.com/parts/LM7805T/TAEJIN/view-part/?ref=snap; Package: TO-220-3 TAEJIN; Value: *; MP: LM7805T; Check_prices: https://www.snapeda.com/parts/LM7805T/TAEJIN/view-part/?ref=eda
U12 = MC34063ADR2G: Buck, Boost Switching Regulator IC Positive or Negative Adjustable 1.25V 1 Output 1.5A (Switch) 8-SOIC (0.154, 3.90mm Width); MF: ON Semiconductor; SnapEDA_Link: https://www.snapeda.com/parts/MC34063ADR2G/Onsemi/view-part/?ref=snap; Package: SOIC-8 ON Semiconductor; Value: *; MP: MC34063ADR2G; Check_prices: https://www.snapeda.com/parts/MC34063ADR2G/Onsemi/view-part/?ref=eda
D1 = SS24M: Value: *; MP: SS24M; Package: None; Price: None; Availability: Unavailable

## Sheet PID_Controller.SchDoc
size A; SheetNumber: 6; SheetTotal: 7
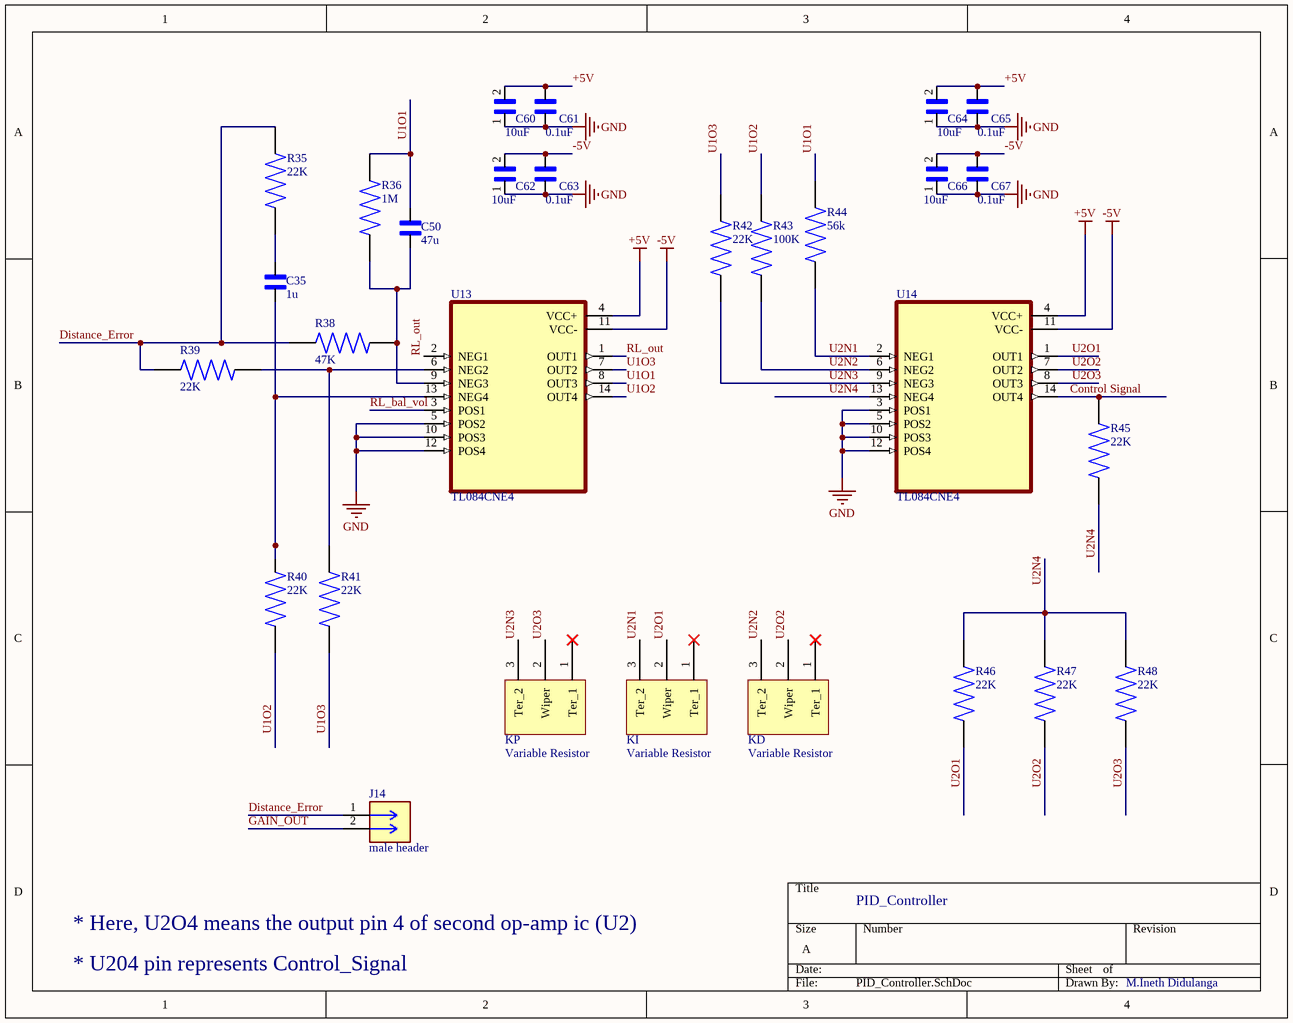
[diagram p5: PID_Controller.SchDoc]

### Parts
C35  1u  [CAPC2012X140N]
C50  47u  [CAPC2012X140N]
C60  10uF  [CAPC2012X145N]
C61  0.1uF  [CAPC2012X140N]
C62  10uF  [CAPC2012X145N]
C63  0.1uF  [CAPC2012X140N]
C64  10uF  [CAPC2012X145N]
C65  0.1uF  [CAPC2012X140N]
C66  10uF  [CAPC2012X145N]
C67  0.1uF  [CAPC2012X140N]
J14  male header  [CONN02_901200922_MOL]
KD  Variable Resistor  [PCBComponent_1]
KI  Variable Resistor  [PCBComponent_1]
KP  Variable Resistor  [PCBComponent_1]
R35  22K  [RESC2012X65N]
R36  1M  [RESC2012X55N]
R38  47K  [RESC2012X65N]
R39  22K  [RESC2012X65N]
R40  22K  [RESC2012X65N]
R41  22K  [RESC2012X65N]
R42  22K  [RESC2012X65N]
R43  100K  [RESC2012X55N]
R44  56k  [RESC2012X55N]
R45  22K  [RESC2012X65N]
R46  22K  [RESC2012X65N]
R47  22K  [RESC2012X65N]
R48  22K  [RESC2012X65N]
U13  TL084CNE4  [SOIC127P780X200-14N]
U14  TL084CNE4  [SOIC127P780X200-14N]

### Nets
+5V: C60.2 C61.1 C64.2 C65.1 U13.4(VCC+) U14.4(VCC+)
-5V: C62.2 C63.1 C66.2 C67.1 U13.11(VCC-) U14.11(VCC-)
GND: C60.1 C61.2 C62.1 C63.2 C64.1 C65.2 C66.1 C67.2 U13.5(POS2) U13.10(POS3) U13.12(POS4) U14.3(POS1) U14.5(POS2) U14.10(POS3) U14.12(POS4)
Control Signal: R45.2 U14.14(OUT4)
Distance_Error: J14.1 R35.2 R38.1 R39.1
GAIN_OUT: J14.2
RL_bal_vol: U13.3(POS1)
RL_out: U13.1(OUT1) U13.2(NEG1)
U1O1: C50.1 R36.2 R44.2 U13.8(OUT3)
U1O2: R40.1 R43.2 U13.14(OUT4)
U1O3: R41.1 R42.2 U13.7(OUT2)
U2N1: KI.3(Ter_2) R44.1 U14.2(NEG1)
U2N2: KD.3(Ter_2) R43.1 U14.6(NEG2)
U2N3: KP.3(Ter_2) R42.1 U14.9(NEG3)
U2N4: R45.1 R46.2 R47.2 R48.2 U14.13(NEG4)
U2O1: KI.2(Wiper) R46.1 U14.1(OUT1)
U2O2: KD.2(Wiper) R47.1 U14.7(OUT2)
U2O3: KP.2(Wiper) R48.1 U14.8(OUT3)
NetC35_1: C35.1 R35.1
NetC35_2: C35.2 R40.2 U13.13(NEG4)
NetC50_2: C50.2 R36.1 R38.2 U13.9(NEG3)
NetR39_2: R39.2 R41.2 U13.6(NEG2)

Not connected (* = marked no-connect by the designer): KD 1(Ter_1)*; KI 1(Ter_1)*; KP 1(Ter_1)*

### Notes on the sheet
- PID_Controller
- * Here, U2O4 means the output pin 4 of second op-amp ic (U2)
- * U204 pin represents Control_Signal
- M.Ineth Didulanga

### Library data of the parts
C35 C50 C61 C63 C65 C67 = FS055C104K4Z2A: as C2 on sheet PWM_Generator; SnapEDA_Link: https://www.snapeda.com/parts/FS055C104K4Z2A/AVX/view-part/?ref=snap; Package: 0805-2 AVX; Value: *; MP: FS055C104K4Z2A; Check_prices: https://www.snapeda.com/parts/FS055C104K4Z2A/AVX/view-part/?ref=eda
C60 C62 C64 C66 = C2012X6S1C106K125AC: as C1 on sheet PWM_Generator; MP: C2012X6S1C106K125AC; SnapEDA_Link: https://www.snapeda.com/parts/C2012X6S1C106K125AC/TDK-Lambda+Americas+Inc/view-part/?ref=snap; Check_prices: https://www.snapeda.com/parts/C2012X6S1C106K125AC/TDK-Lambda+Americas+Inc/view-part/?ref=eda; Value: *; Purchase-URL: https://pricing.snapeda.com/search/part/C2012X6S1C106K125AC/?ref=eda; Package: 2012 TDK
J14 = 901200922: Package: None; Price: None; Value: *; MP: 901200922; Availability: Unavailable
R35 R39-R42 R45-R48 = CRGCQ0805F22K: as R3 on sheet PWM_Generator; SnapEDA_Link: https://www.snapeda.com/parts/CRGCQ0805F22K/TE+Connectivity/view-part/?ref=snap; Package: 2012 TE Connectivity; Value: *; MP: CRGCQ0805F22K; Check_prices: https://www.snapeda.com/parts/CRGCQ0805F22K/TE+Connectivity/view-part/?ref=eda
R36 R43 R44 = MCU08050C1002FPW00: as R2 on sheet PWM_Generator; SnapEDA_Link: https://www.snapeda.com/parts/MCU08050C1002FPW00/Vishay/view-part/?ref=snap; Package: 2012 Vishay; Value: *; MP: MCU08050C1002FPW00; Check_prices: https://www.snapeda.com/parts/MCU08050C1002FPW00/Vishay/view-part/?ref=eda
R38 = CRGCQ0805F47K: as R1 on sheet PWM_Generator; SnapEDA_Link: https://www.snapeda.com/parts/CRGCQ0805F47K/TE+Connectivity/view-part/?ref=snap; Package: 2012 TE Connectivity; Value: *; MP: CRGCQ0805F47K; Check_prices: https://www.snapeda.com/parts/CRGCQ0805F47K/TE+Connectivity/view-part/?ref=eda
U13 U14 = TL084CNE4: as U1 on sheet PWM_Generator; SnapEDA_Link: https://www.snapeda.com/parts/TL084CNE4/Texas+Instruments/view-part/?ref=snap; Package: PDIP-14 Texas Instruments; Value: *; MP: TL084CNE4; Check_prices: https://www.snapeda.com/parts/TL084CNE4/Texas+Instruments/view-part/?ref=eda

## Sheet Front Obstacle Brake.SchDoc
size A; SheetNumber: 7; SheetTotal: 7
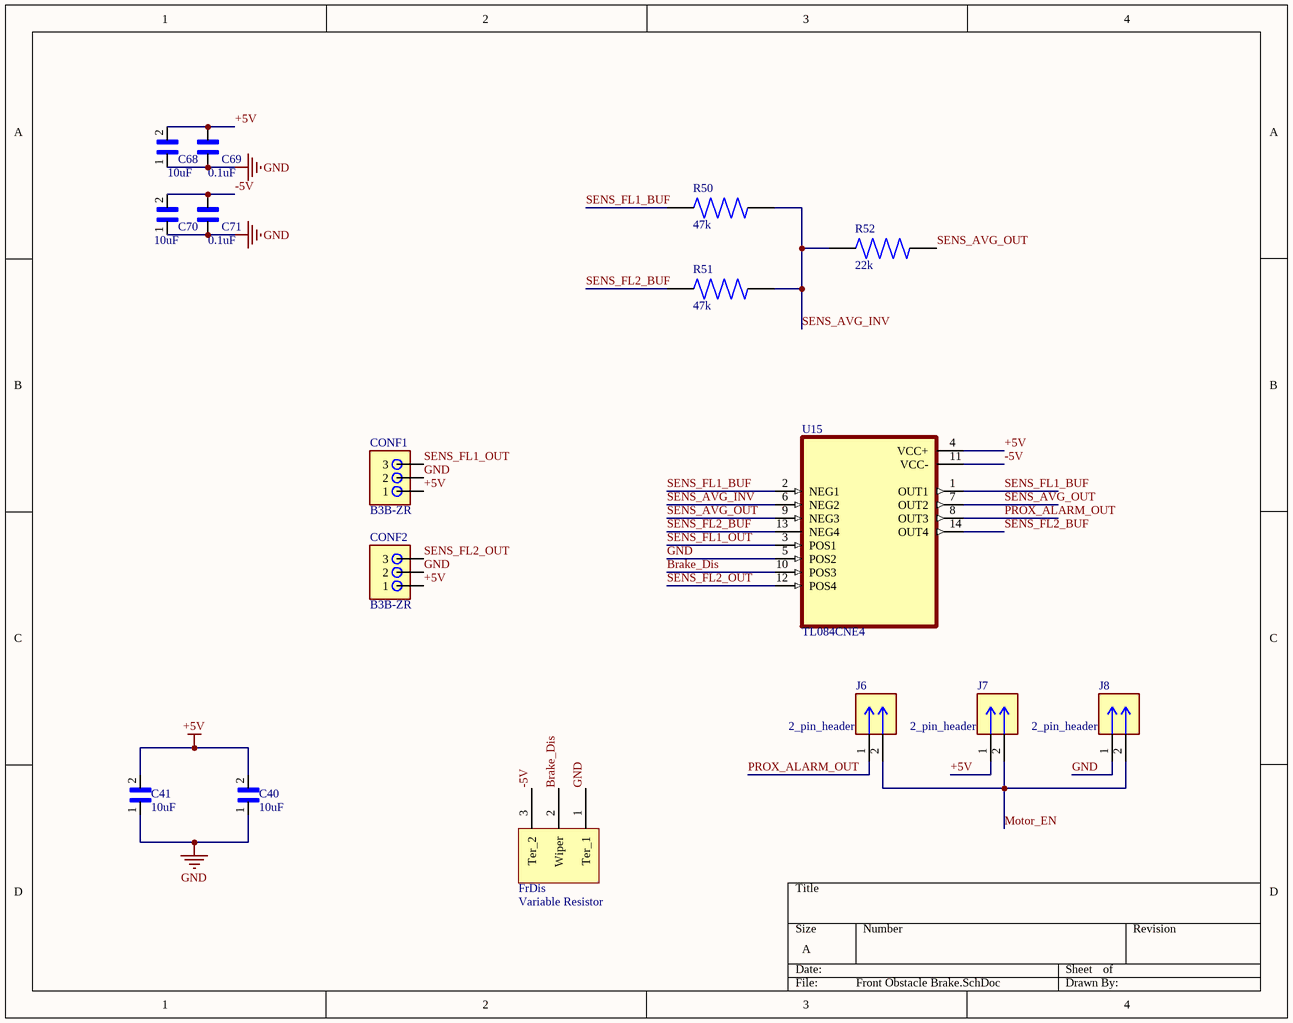
[diagram p6: Front Obstacle Brake.SchDoc]

### Parts
C40  10uF  [CAPC2012X145N]
C41  10uF  [CAPC2012X145N]
C68  10uF  [CAPC2012X145N]
C69  0.1uF  [CAPC2012X140N]
C70  10uF  [CAPC2012X145N]
C71  0.1uF  [CAPC2012X140N]
CONF1  B3B-ZR  [B3B-ZR]
CONF2  B3B-ZR  [B3B-ZR]
FrDis  Variable Resistor  [PCBComponent_1]
J6  2_pin_header  [CONN02_901200922_MOL]
J7  2_pin_header  [CONN02_901200922_MOL]
J8  2_pin_header  [CONN02_901200922_MOL]
R50  47k  [RESC2012X65N]
R51  47k  [RESC2012X65N]
R52  22k  [RESC2012X65N]
U15  TL084CNE4  [SOIC127P780X200-14N]

### Nets
+5V: C40.2 C41.2 C68.2 C69.1 CONF1.1 CONF2.1 J7.1 U15.4(VCC+)
-5V: C70.2 C71.1 FrDis.3(Ter_2) U15.11(VCC-)
GND: C40.1 C41.1 C68.1 C69.2 C70.1 C71.2 CONF1.2 CONF2.2 FrDis.1(Ter_1) J8.1 U15.5(POS2)
Brake_Dis: FrDis.2(Wiper) U15.10(POS3)
Motor_EN: J6.2 J7.2 J8.2
PROX_ALARM_OUT: J6.1 U15.8(OUT3)
SENS_AVG_INV: R50.2 R51.2 R52.1 U15.6(NEG2)
SENS_AVG_OUT: R52.2 U15.7(OUT2) U15.9(NEG3)
SENS_FL1_BUF: R50.1 U15.1(OUT1) U15.2(NEG1)
SENS_FL1_OUT: CONF1.3 U15.3(POS1)
SENS_FL2_BUF: R51.1 U15.13(NEG4) U15.14(OUT4)
SENS_FL2_OUT: CONF2.3 U15.12(POS4)

### Library data of the parts
C40 C41 C68 C70 = C2012X6S1C106K125AC: as C1 on sheet PWM_Generator; MP: C2012X6S1C106K125AC; SnapEDA_Link: https://www.snapeda.com/parts/C2012X6S1C106K125AC/TDK-Lambda+Americas+Inc/view-part/?ref=snap; Check_prices: https://www.snapeda.com/parts/C2012X6S1C106K125AC/TDK-Lambda+Americas+Inc/view-part/?ref=eda; Value: *; Purchase-URL: https://pricing.snapeda.com/search/part/C2012X6S1C106K125AC/?ref=eda; Package: 2012 TDK
C69 C71 = FS055C104K4Z2A: as C2 on sheet PWM_Generator; SnapEDA_Link: https://www.snapeda.com/parts/FS055C104K4Z2A/AVX/view-part/?ref=snap; Package: 0805-2 AVX; Value: *; MP: FS055C104K4Z2A; Check_prices: https://www.snapeda.com/parts/FS055C104K4Z2A/AVX/view-part/?ref=eda
CONF1 CONF2 = B3B-ZR: as CON_L on sheet Sensor_Interface_SharpIR; SnapEDA_Link: https://www.snapeda.com/parts/B3B-ZR/JST+Sales+America+Inc./view-part/?ref=snap; Package: None; Value: *; MP: B3B-ZR; Check_prices: https://www.snapeda.com/parts/B3B-ZR/JST+Sales+America+Inc./view-part/?ref=eda
J6-J8 = 901200922: Package: None; Price: None; Value: *; MP: 901200922; Availability: Unavailable
R50 R51 = CRGCQ0805F47K: as R1 on sheet PWM_Generator; SnapEDA_Link: https://www.snapeda.com/parts/CRGCQ0805F47K/TE+Connectivity/view-part/?ref=snap; Package: 2012 TE Connectivity; Value: *; MP: CRGCQ0805F47K; Check_prices: https://www.snapeda.com/parts/CRGCQ0805F47K/TE+Connectivity/view-part/?ref=eda
R52 = CRGCQ0805F22K: as R3 on sheet PWM_Generator; SnapEDA_Link: https://www.snapeda.com/parts/CRGCQ0805F22K/TE+Connectivity/view-part/?ref=snap; Package: 2012 TE Connectivity; Value: *; MP: CRGCQ0805F22K; Check_prices: https://www.snapeda.com/parts/CRGCQ0805F22K/TE+Connectivity/view-part/?ref=eda
U15 = TL084CNE4: as U1 on sheet PWM_Generator; SnapEDA_Link: https://www.snapeda.com/parts/TL084CNE4/Texas+Instruments/view-part/?ref=snap; Package: PDIP-14 Texas Instruments; Value: *; MP: TL084CNE4; Check_prices: https://www.snapeda.com/parts/TL084CNE4/Texas+Instruments/view-part/?ref=eda

## Nets that join several sheets
+5V: PWM_Generator (7 pins), Differential_Drive_Mixer (8 pins), Sensor_Interface_SharpIR (7 pins), Power_Management (C31.2 U10.3), PID_Controller (6 pins), Front Obstacle Brake (8 pins)
-5V: PWM_Generator (6 pins), Differential_Drive_Mixer (8 pins), Sensor_Interface_SharpIR (C20.2 C21.1 U5.11), Power_Management (C33.2 U11.3), PID_Controller (6 pins), Front Obstacle Brake (C70.2 C71.1 FrDis.3 U15.11)
GND: PWM_Generator (13 pins), Differential_Drive_Mixer (12 pins), Sensor_Interface_SharpIR (10 pins), Mosfet_HBridge_Driver (14 pins), Power_Management (13 pins), PID_Controller (15 pins), Front Obstacle Brake (11 pins)
VIN_Motor: Mosfet_HBridge_Driver (12 pins), Power_Management (Q2.5 Q2.6 Q2.7 Q2.8)
Control Signal: Differential_Drive_Mixer (J13.2), PID_Controller (R45.2 U14.14)
Diff L: PWM_Generator (L_S.2), Differential_Drive_Mixer (R18.2 U4.8)
Diff R: PWM_Generator (R_S.2), Differential_Drive_Mixer (R19.2 U4.14)
GAIN_OUT: Sensor_Interface_SharpIR (PreMul.2 U5.7), PID_Controller (J14.2)
Motor_EN: Power_Management (R33.1), Front Obstacle Brake (J6.2 J7.2 J8.2)
PWM_L: PWM_Generator (R5.2 U2.14), Mosfet_HBridge_Driver (U9.2)
PWM_R: PWM_Generator (R6.2 U2.8), Mosfet_HBridge_Driver (U8.2)
RL_bal_vol: Differential_Drive_Mixer (RL_Bal.2), PID_Controller (U13.3)
RL_out: Differential_Drive_Mixer (R49.1), PID_Controller (U13.1 U13.2)